# Altium schematic sheet 01.CH32V307VCT6_MCU.SchDoc: 01.CH32V307VCT6_MCU
size A3; Organization: Altium Limited; Address1: L3, 12a Rodborough Rd; Address2: Frenchs Forest; Address3: NSW; Address4: Australia 2086; Revision: V1; SheetNumber: 2; SheetTotal: 6; Project: CH32V307VCT6
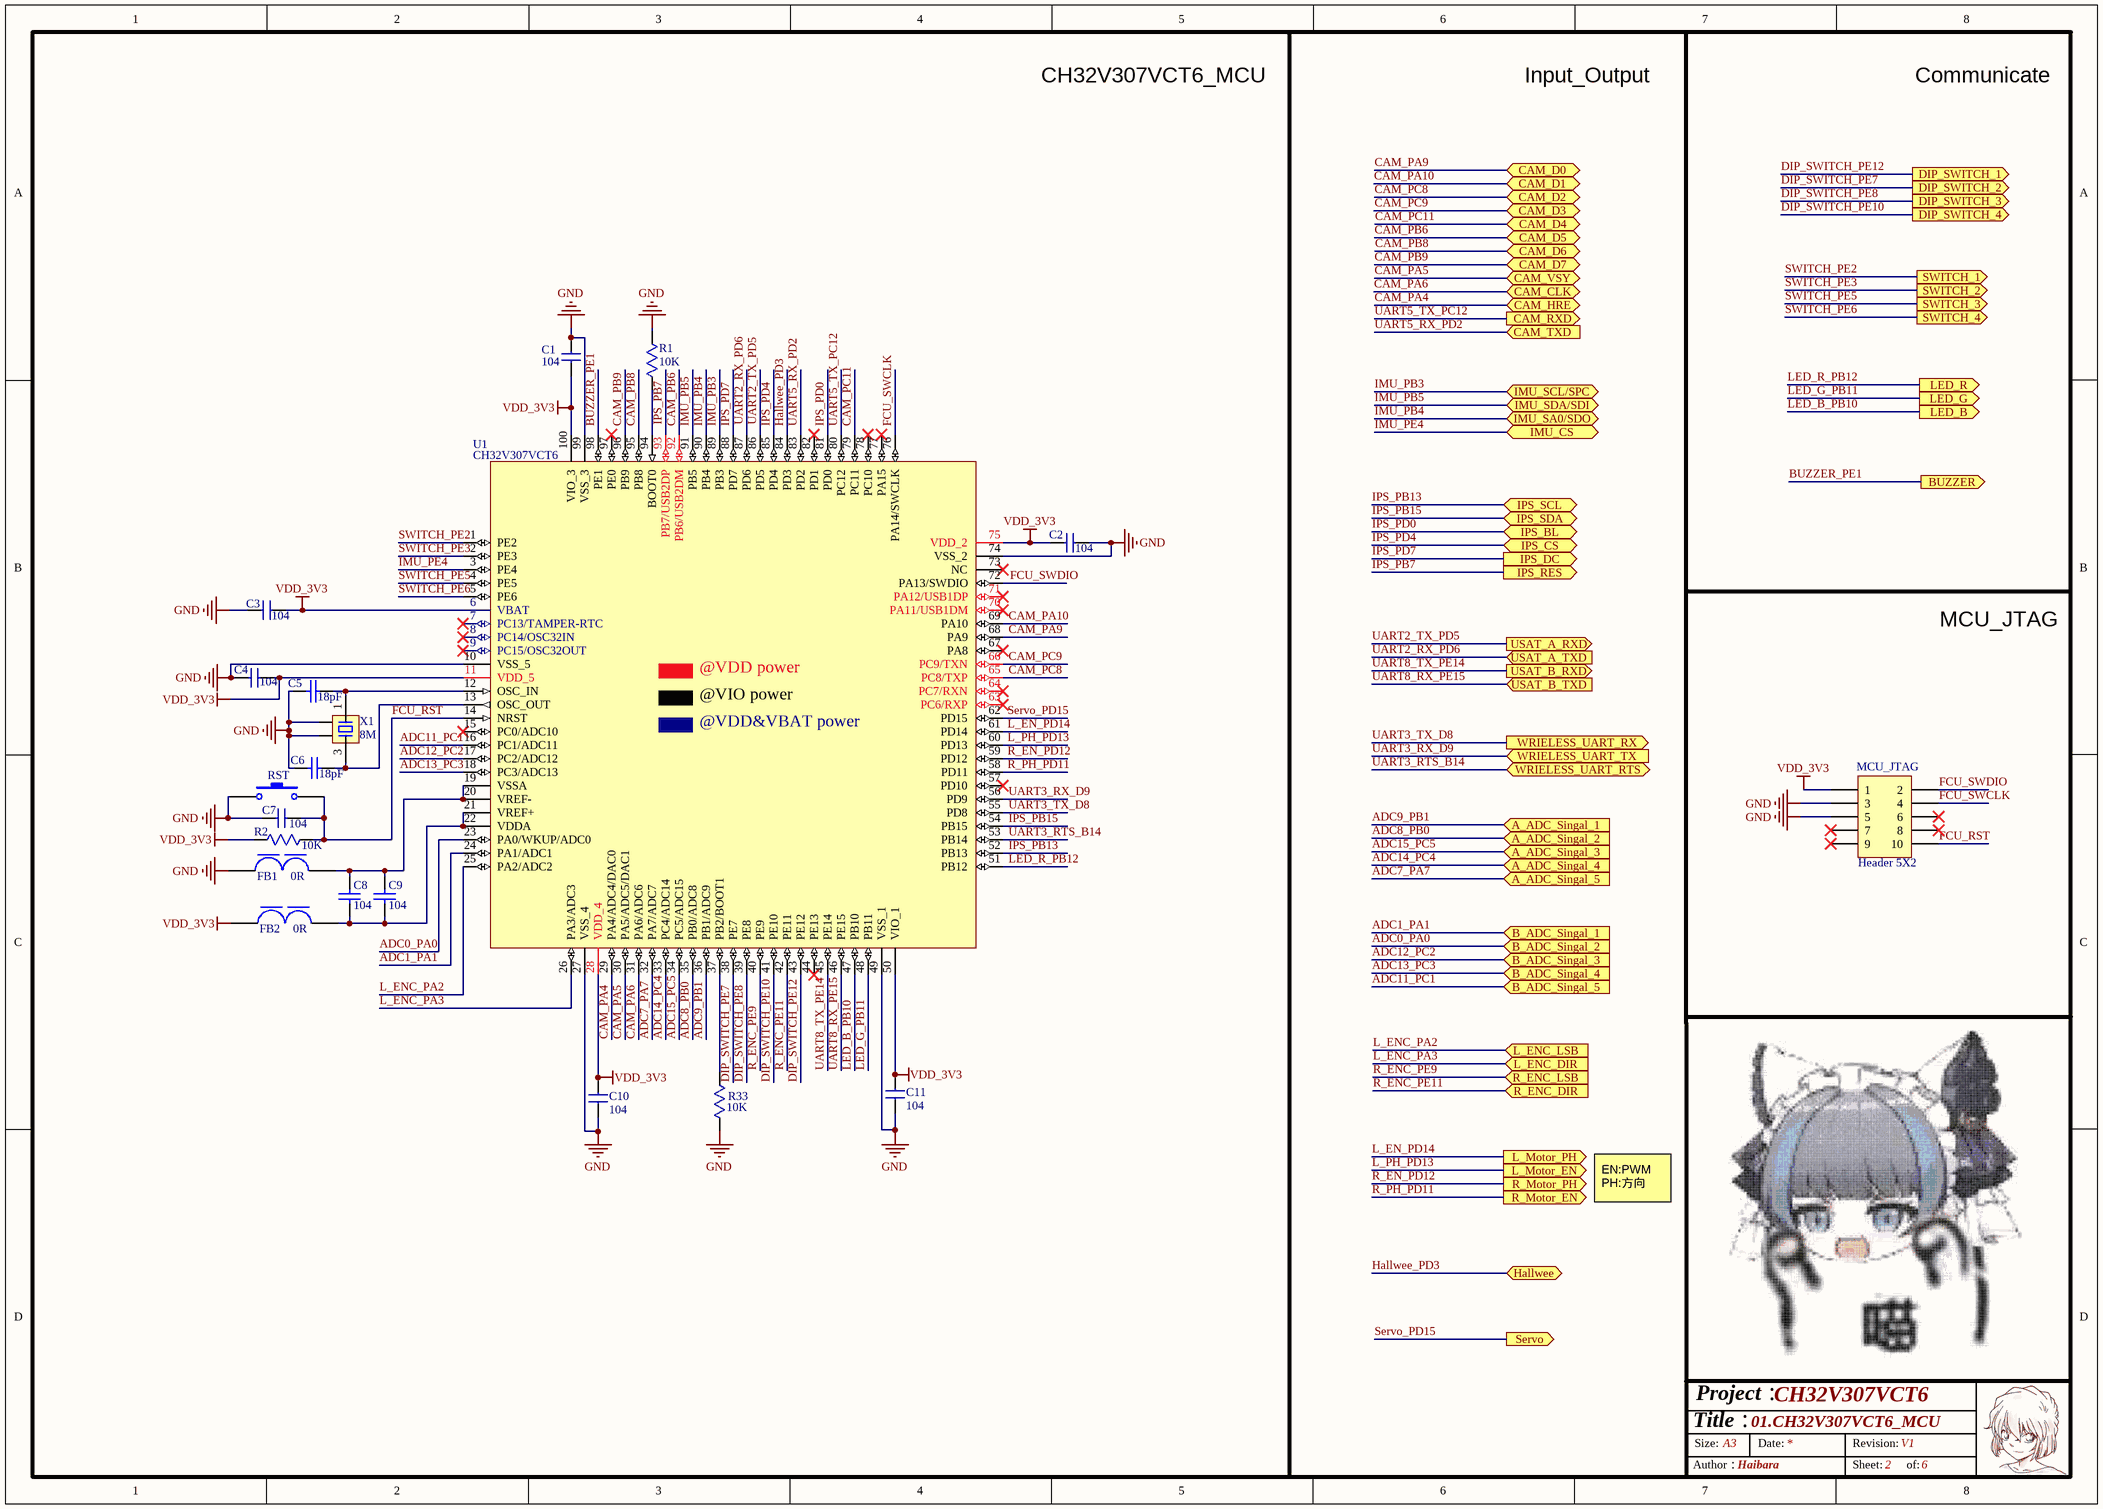
[diagram p0: 01.CH32V307VCT6_MCU.SchDoc]

## Parts
C1  104  [C0603]
C2  104  [C0603]
C3  104  [C0603]
C4  104  [C0603]
C5  18pF  [0603 电容 C3]
C6  18pF  [0603 电容 C3]
C7  104  [C0603]
C8  104  [0603 电容 C3]
C9  104  [0603 电容 C3]
C10  104  [C0603]
C11  104  [C0603]
FB1  0R  [0805 磁珠 FB3]
FB2  0R  [0805 磁珠 FB3]
MCU_JTAG  Header 5X2  [DC-2.54-L-Z-10P]
R1  10K  [R0603]
R2  10K  [R0603]
R33  10K  [R0603]
RST  SW-PB  [TSW SMD-3*6*2.5]  (value not drawn)
U1  CH32V307VCT6  [LQFP100]
X1  8M  [OSC 3225-4P]

## Ports
A_ADC_Singal_1 (in), A_ADC_Singal_2 (in), A_ADC_Singal_3 (in), A_ADC_Singal_4 (in), A_ADC_Singal_5 (in), B_ADC_Singal_1 (in), B_ADC_Singal_2 (in), B_ADC_Singal_3 (in), B_ADC_Singal_4 (in), B_ADC_Singal_5 (in), BUZZER (out), CAM_CLK (bidir), CAM_D0 (bidir), CAM_D1 (bidir), CAM_D2 (bidir), CAM_D3 (bidir), CAM_D4 (bidir), CAM_D5 (bidir), CAM_D6 (bidir), CAM_D7 (bidir), CAM_HRE (bidir), CAM_RXD (out), CAM_TXD (in), CAM_VSY (bidir), DIP_SWITCH_1 (out), DIP_SWITCH_2 (out), DIP_SWITCH_3 (out), DIP_SWITCH_4 (out), Hallwee (bidir), IMU_CS (bidir), IMU_SA0/SDO (bidir), IMU_SCL/SPC (bidir), IMU_SDA/SDI (bidir), IPS_BL (bidir), IPS_CS (bidir), IPS_DC (out), IPS_RES (out), IPS_SCL (bidir), IPS_SDA (bidir), L_ENC_DIR (in), L_ENC_LSB (in), L_Motor_EN (out), L_Motor_PH (out), LED_B (out), LED_G (out), LED_R (out), R_ENC_DIR (in), R_ENC_LSB (in), R_Motor_EN (out), R_Motor_PH (out), Servo (out), SWITCH_1 (out), SWITCH_2 (out), SWITCH_3 (out), SWITCH_4 (out), USAT_A_RXD (out), USAT_A_TXD (in), USAT_B_RXD (out), USAT_B_TXD (in), WRIELESS_UART_RTS (bidir), WRIELESS_UART_RX (out), WRIELESS_UART_TX (in)

## Nets
GND: C1.2 C2.2 C3.1 C4.2 C5.1 C6.2 C7.1 C10.2 C11.2 FB1.1 MCU_JTAG.3 MCU_JTAG.5 R1.1 R33.1 RST.1 U1.10(VSS_5) U1.27(VSS_4) U1.49(VSS_1) U1.74(VSS_2) U1.99(VSS_3) X1.2 X1.4
VDD_3V3: C1.1 C2.1 C3.2 C4.1 C10.1 C11.1 FB2.1 MCU_JTAG.1 R2.1 U1.6(VBAT) U1.11(VDD_5) U1.28(VDD_4) U1.50(VIO_1) U1.75(VDD_2) U1.100(VIO_3)
ADC0_PA0: U1.23(PA0/WKUP/ADC0) ; port B_ADC_Singal_2
ADC1_PA1: U1.24(PA1/ADC1) ; port B_ADC_Singal_1
ADC7_PA7: U1.32(PA7/ADC7) ; port A_ADC_Singal_5
ADC8_PB0: U1.35(PB0/ADC8) ; port A_ADC_Singal_2
ADC9_PB1: U1.36(PB1/ADC9) ; port A_ADC_Singal_1
ADC11_PC1: U1.16(PC1/ADC11) ; port B_ADC_Singal_5
ADC12_PC2: U1.17(PC2/ADC12) ; port B_ADC_Singal_3
ADC13_PC3: U1.18(PC3/ADC13) ; port B_ADC_Singal_4
ADC14_PC4: U1.33(PC4/ADC14) ; port A_ADC_Singal_4
ADC15_PC5: U1.34(PC5/ADC15) ; port A_ADC_Singal_3
BUZZER_PE1: U1.98(PE1) ; port BUZZER
CAM_PA4: U1.29(PA4/ADC4/DAC0) ; port CAM_HRE
CAM_PA5: U1.30(PA5/ADC5/DAC1) ; port CAM_VSY
CAM_PA6: U1.31(PA6/ADC6) ; port CAM_CLK
CAM_PA9: U1.68(PA9) ; port CAM_D0
CAM_PA10: U1.69(PA10) ; port CAM_D1
CAM_PB6: U1.92(PB6/USB2DM) ; port CAM_D5
CAM_PB8: U1.95(PB8) ; port CAM_D6
CAM_PB9: U1.96(PB9) ; port CAM_D7
CAM_PC8: U1.65(PC8/TXP) ; port CAM_D2
CAM_PC9: U1.66(PC9/TXN) ; port CAM_D3
CAM_PC11: U1.79(PC11) ; port CAM_D4
DIP_SWITCH_PE7: U1.38(PE7) ; port DIP_SWITCH_2
DIP_SWITCH_PE8: U1.39(PE8) ; port DIP_SWITCH_3
DIP_SWITCH_PE10: U1.41(PE10) ; port DIP_SWITCH_4
DIP_SWITCH_PE12: U1.43(PE12) ; port DIP_SWITCH_1
FCU_RST: C7.2 MCU_JTAG.10 R2.2 RST.2 U1.14(NRST)
FCU_SWCLK: MCU_JTAG.4 U1.76(PA14/SWCLK)
FCU_SWDIO: MCU_JTAG.2 U1.72(PA13/SWDIO)
Hallwee_PD3: U1.84(PD3) ; port Hallwee
IMU_PB3: U1.89(PB3) ; port IMU_SCL/SPC
IMU_PB4: U1.90(PB4) ; port IMU_SA0/SDO
IMU_PB5: U1.91(PB5) ; port IMU_SDA/SDI
IMU_PE4: U1.3(PE4) ; port IMU_CS
IPS_PB7: U1.93(PB7/USB2DP) ; port IPS_RES
IPS_PB13: U1.52(PB13) ; port IPS_SCL
IPS_PB15: U1.54(PB15) ; port IPS_SDA
IPS_PD0: U1.81(PD0) ; port IPS_BL
IPS_PD4: U1.85(PD4) ; port IPS_CS
IPS_PD7: U1.88(PD7) ; port IPS_DC
L_EN_PD14: U1.61(PD14) ; port L_Motor_PH
L_ENC_PA2: U1.25(PA2/ADC2) ; port L_ENC_LSB
L_ENC_PA3: U1.26(PA3/ADC3) ; port L_ENC_DIR
L_PH_PD13: U1.60(PD13) ; port L_Motor_EN
LED_B_PB10: U1.47(PB10) ; port LED_B
LED_G_PB11: U1.48(PB11) ; port LED_G
LED_R_PB12: U1.51(PB12) ; port LED_R
R_EN_PD12: U1.59(PD12) ; port R_Motor_PH
R_ENC_PE9: U1.40(PE9) ; port R_ENC_LSB
R_ENC_PE11: U1.42(PE11) ; port R_ENC_DIR
R_PH_PD11: U1.58(PD11) ; port R_Motor_EN
Servo_PD15: U1.62(PD15) ; port Servo
SWITCH_PE2: U1.1(PE2) ; port SWITCH_1
SWITCH_PE3: U1.2(PE3) ; port SWITCH_2
SWITCH_PE5: U1.4(PE5) ; port SWITCH_3
SWITCH_PE6: U1.5(PE6) ; port SWITCH_4
UART2_RX_PD6: U1.87(PD6) ; port USAT_A_TXD
UART2_TX_PD5: U1.86(PD5) ; port USAT_A_RXD
UART3_RTS_B14: U1.53(PB14) ; port WRIELESS_UART_RTS
UART3_RX_D9: U1.56(PD9) ; port WRIELESS_UART_TX
UART3_TX_D8: U1.55(PD8) ; port WRIELESS_UART_RX
UART5_RX_PD2: U1.83(PD2) ; port CAM_TXD
UART5_TX_PC12: U1.80(PC12) ; port CAM_RXD
UART8_RX_PE15: U1.46(PE15) ; port USAT_B_TXD
UART8_TX_PE14: U1.45(PE14) ; port USAT_B_RXD
NetC5_2: C5.2 U1.12(OSC_IN) X1.1
NetC6_1: C6.1 U1.13(OSC_OUT) X1.3
NetC8_1: C8.1 C9.1 FB1.2 U1.19(VSSA) U1.20(VREF-)
NetC8_2: C8.2 C9.2 FB2.2 U1.21(VREF+) U1.22(VDDA)
NetR1_2: R1.2 U1.94(BOOT0)
NetR33_2: R33.2 U1.37(PB2/BOOT1)

Not connected (* = marked no-connect by the designer): MCU_JTAG 6* 7* 8* 9*; U1 7(PC13/TAMPER-RTC)* 8(PC14/OSC32IN)* 9(PC15/OSC32OUT)* 15(PC0/ADC10)* 44(PE13)* 57(PD10)* 63(PC6/RXP)* 64(PC7/RXN)* 67(PA8)* 70(PA11/USB1DM)* 71(PA12/USB1DP)* 73(NC)* 77(PA15)* 78(PC10)* 82(PD1)* 97(PE0)*

## Notes on the sheet
- CH32V307VCT6_MCU
- Input_Output
- Communicate
- MCU_JTAG
- EN:PWM
  PH:方向
- Title：
- Size:
- Project：
- A3
- Date:
- Revision:
- Author：
- Haibara
- Sheet:
- of:
- (in symbol CH32V307V) @VDD power; @VIO power; @VDD&VBAT power

## Library data of the parts
C1-C4 C7 C10 C11 = 电容
C5 C6 C8 C9 = Cap: Capacitor; Published: 8-Jun-2000; LatestRevisionDate: 17-Jul-2002; LatestRevisionNote: Re-released for DXP Platform.; PackageReference: RAD-0.3; Publisher: Altium Limited; PackageDescription: Radial Cap, Thru-Hole; 2 Leads; 0.3 in Pin Spacing
FB1 FB2 = FB
MCU_JTAG = Header 5X2: Header, 5-Pin, Dual row; LatestRevisionDate: 17-Jul-2002; LatestRevisionNote: Re-released for DXP Platform.; Publisher: Altium Limited
R1 R2 R33 = 电阻
RST = SW-PB: Switch; Published: 24-Mar-1999; LatestRevisionDate: 17-Jul-2002; LatestRevisionNote: Re-released for DXP Platform.; PackageReference: SPST-2; Publisher: Altium Limited; PackageDescription: Switch; 2 Leads
U1 = CH32V307V: RISC-V FPU HD-MCU, 144MHz, USB_480M, USB OTG, 1000M Ethernet MAC, 2*CAN, FSMC+DVP
X1 = XTAL-4P: 4脚无源晶振; 版权归属: 源创客; BOM名称: 4脚无源晶振; 学习资源: www.ooocke.com